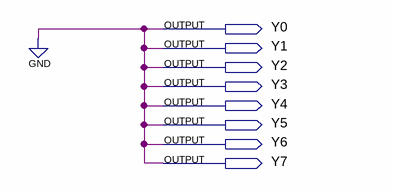
[diagram p0: schematic sheet]
// Quartus schematic 0_Value_8_bit.bdf as structural Verilog: 0 symbols, 8 pins
module \0_Value_8_bit  (
  output Y0,
  output Y1,
  output Y2,
  output Y3,
  output Y4,
  output Y5,
  output Y6,
  output Y7
);


  assign Y0 = 1'b0;
  assign Y1 = 1'b0;
  assign Y2 = 1'b0;
  assign Y3 = 1'b0;
  assign Y4 = 1'b0;
  assign Y5 = 1'b0;
  assign Y6 = 1'b0;
  assign Y7 = 1'b0;
endmodule
